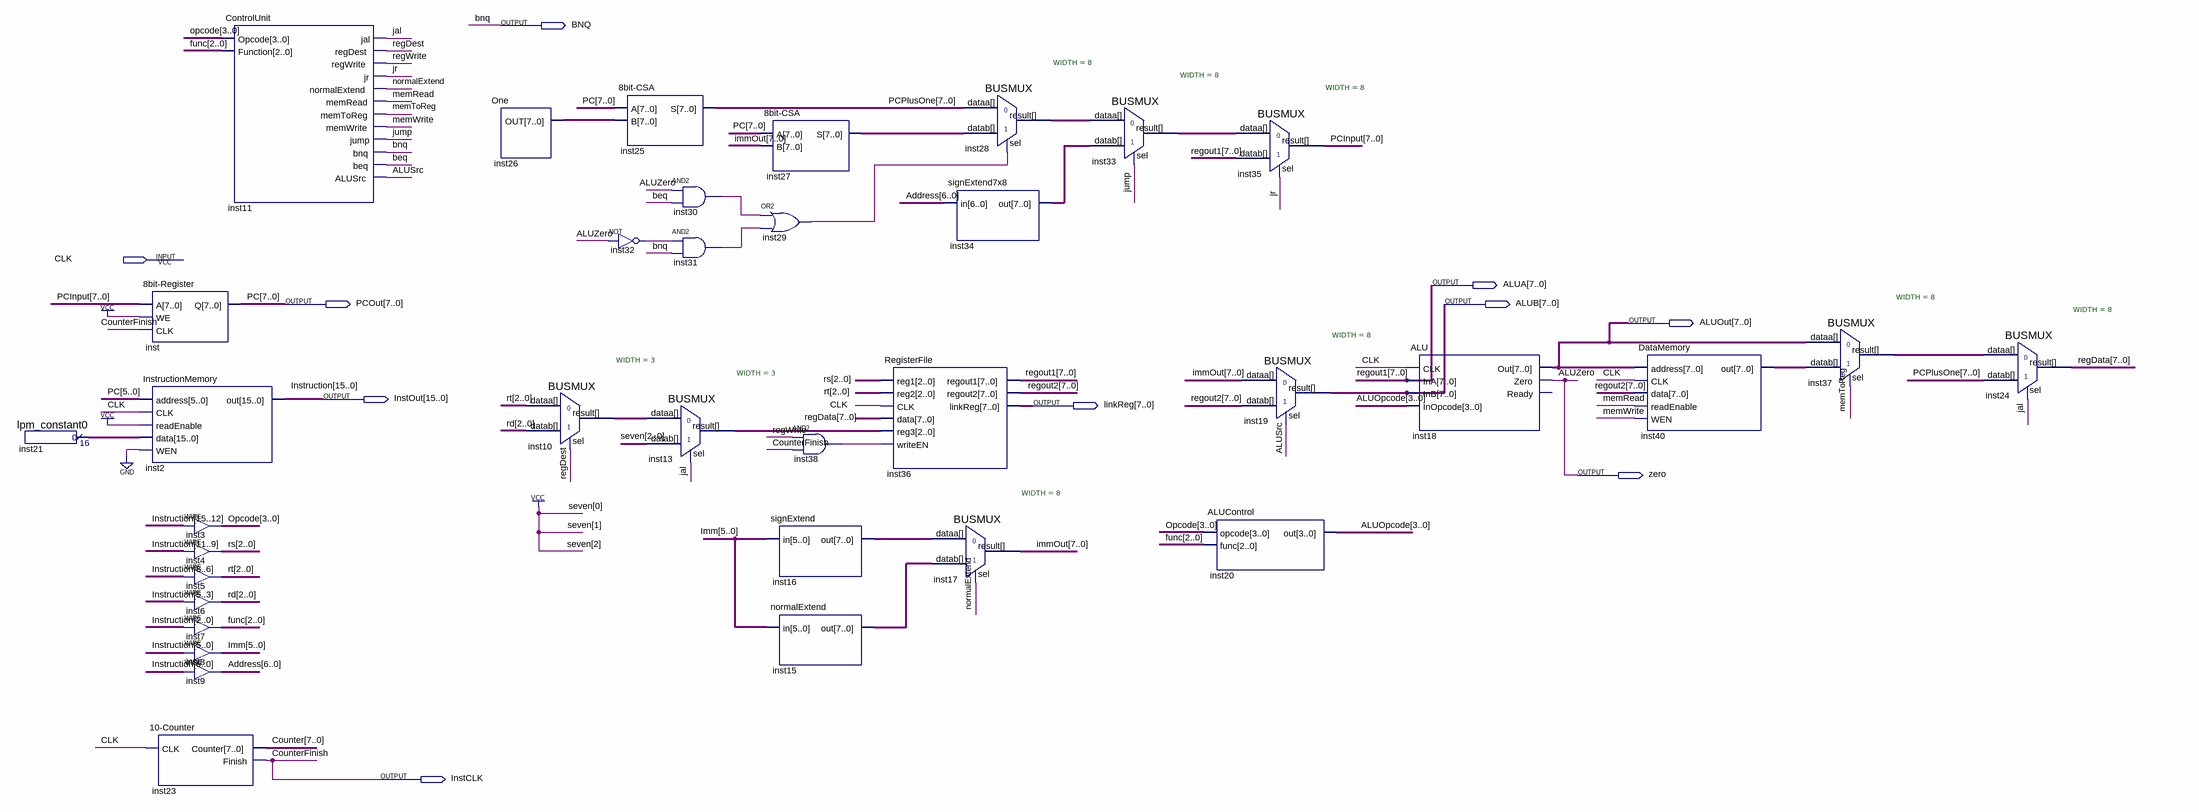
[diagram p0: schematic sheet]
// Quartus schematic Datapath.bdf as structural Verilog: 36 symbols, 10 pins
module Datapath (
  input  CLK,
  output BNQ,
  output [7:0] ALUA,
  output [7:0] PCOut,
  output [7:0] ALUB,
  output [7:0] ALUOut,
  output [15:0] InstOut,
  output [7:0] linkReg,
  output zero,
  output InstCLK
);

  wire ALUSrc, beq, inst29_out, inst30_out, inst31_out, inst32_out, inst38_out, jal, jr, jump, memRead,
       memToReg, memWrite, normalExtend, regDest, regWrite;
  wire [2:0] func, inst10_result, inst13_result, rd, rs, rt;
  wire [3:0] ALUOpcode, opcode;
  wire [5:0] Imm;
  wire [6:0] Address;
  wire [7:0] Counter, immOut, inst15_out, inst16_out, inst26_out, inst27_s, inst28_result, inst33_result,
       inst34_out, inst37_result, inst40_out, PCInput, PCPlusOne, regData, regout2;
  wire [15:0] inst21_result;

  lpm_constant0 inst21 (.result(inst21_result));
  \8bit-Register  inst (.A(PCInput), .WE(1'b1), .CLK(InstCLK), .Q(PCOut));
  InstructionMemory inst2 (
    .address(PCOut[5:0]), .CLK(CLK), .readEnable(1'b1), .data(inst21_result), .WEN(1'b0), .out(InstOut));
  \10-Counter  inst23 (.CLK(CLK), .Counter(Counter), .Finish(InstCLK));
  assign opcode = InstOut[15:12];  // WIRE inst3
  assign rs = InstOut[11:9];  // WIRE inst4
  assign rt = InstOut[8:6];  // WIRE inst5
  assign rd = InstOut[5:3];  // WIRE inst6
  assign func = InstOut[2:0];  // WIRE inst7
  assign Imm = InstOut[5:0];  // WIRE inst8
  assign Address = InstOut[6:0];  // WIRE inst9
  ControlUnit inst11 (
    .Opcode(opcode), .Function(func), .jal(jal), .regDest(regDest), .regWrite(regWrite), .jr(jr),
    .normalExtend(normalExtend), .memRead(memRead), .memToReg(memToReg), .memWrite(memWrite), .jump(jump),
    .bnq(BNQ), .beq(beq), .ALUSrc(ALUSrc));
  One inst26 (.OUT(inst26_out));
  BUSMUX #(.WIDTH(3)) inst10 (.datab(rd), .sel(regDest), .dataa(rt), .result(inst10_result));
  \8bit-CSA  inst25 (.A(PCOut), .B(inst26_out), .S(PCPlusOne));
  not inst32 (inst32_out, zero);
  BUSMUX #(.WIDTH(3)) inst13 (.datab(3'b111), .sel(jal), .dataa(inst10_result), .result(inst13_result));
  and inst30 (inst30_out, zero, beq);
  and inst31 (inst31_out, inst32_out, BNQ);
  \8bit-CSA  inst27 (.A(PCOut), .B(immOut), .S(inst27_s));
  or inst29 (inst29_out, inst30_out, inst31_out);
  signExtend inst16 (.in(Imm), .out(inst16_out));
  normalExtend inst15 (.in(Imm), .out(inst15_out));
  and inst38 (inst38_out, regWrite, InstCLK);
  RegisterFile inst36 (
    .reg1(rs), .reg2(rt), .CLK(CLK), .data(regData), .reg3(inst13_result), .writeEN(inst38_out),
    .regout1(ALUA), .regout2(regout2), .linkReg(linkReg));
  BUSMUX #(.WIDTH(8)) inst28 (.datab(inst27_s), .sel(inst29_out), .dataa(PCPlusOne), .result(inst28_result));
  signExtend7x8 inst34 (.in(Address), .out(inst34_out));
  BUSMUX #(.WIDTH(8)) inst17 (.datab(inst15_out), .sel(normalExtend), .dataa(inst16_out), .result(immOut));
  BUSMUX #(.WIDTH(8)) inst33 (.datab(inst34_out), .sel(jump), .dataa(inst28_result), .result(inst33_result));
  ALUControl inst20 (.opcode(opcode), .func(func), .out(ALUOpcode));
  BUSMUX #(.WIDTH(8)) inst35 (.datab(ALUA), .sel(jr), .dataa(inst33_result), .result(PCInput));
  BUSMUX #(.WIDTH(8)) inst19 (.datab(regout2), .sel(ALUSrc), .dataa(immOut), .result(ALUB));
  ALU inst18 (.CLK(CLK), .InA(ALUA), .InB(ALUB), .InOpcode(ALUOpcode), .Out(ALUOut), .Zero(zero));  // open: Ready
  DataMemory inst40 (
    .address(ALUOut), .CLK(CLK), .data(regout2), .readEnable(memRead), .WEN(memWrite), .out(inst40_out));
  BUSMUX #(.WIDTH(8)) inst37 (.datab(inst40_out), .sel(memToReg), .dataa(ALUOut), .result(inst37_result));
  BUSMUX #(.WIDTH(8)) inst24 (.datab(PCPlusOne), .sel(jal), .dataa(inst37_result), .result(regData));

  // Other names for the same wires on the sheet: CounterFinish = InstCLK; Instruction[15:0] = InstOut;
  //   PC[7:0] = PCOut; regout1[7:0] = ALUA; ALUZero = zero
endmodule
